# Altium schematic sheet Sheet3.SchDoc
size A4; SheetNumber: 3; SheetTotal: 3
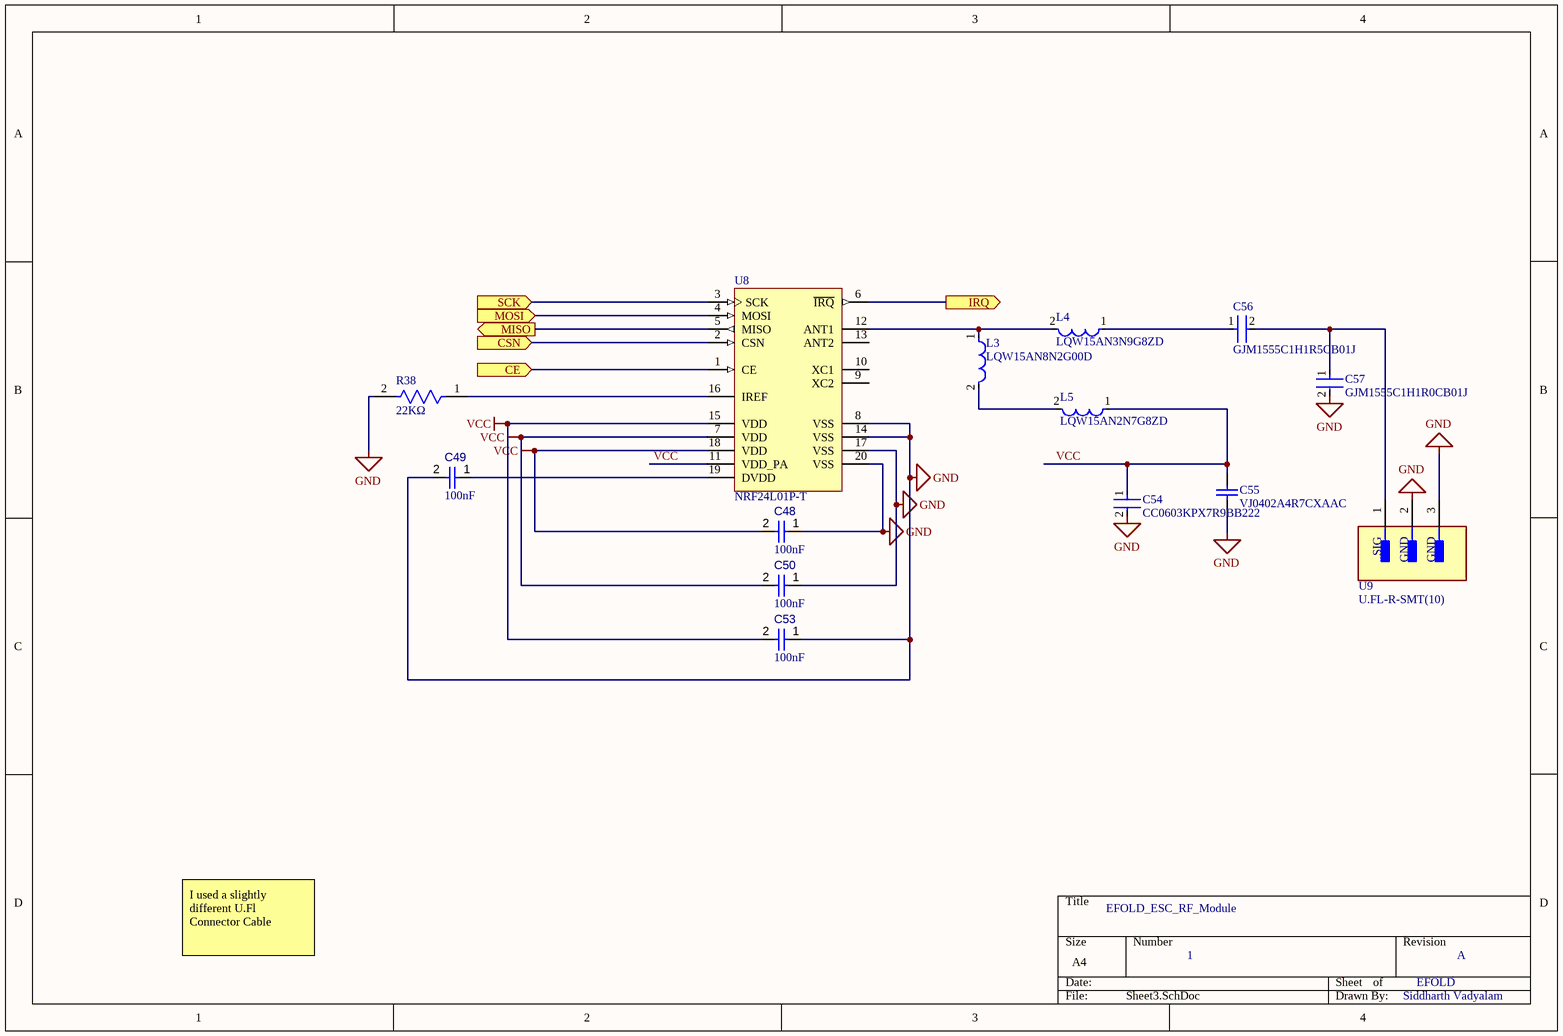
[diagram p0: Sheet3.SchDoc]

## Parts
C48  value 100nF  [CAPC1608X90X40NL10T20]  (hidden comment: Capacitor 100 nF +/-10% 50 V 0603)
C49  value 100nF  [CAPC1608X90X40NL10T20]  (hidden comment: Capacitor 100 nF +/-10% 50 V 0603)
C50  value 100nF  [CAPC1608X90X40NL10T20]  (hidden comment: Capacitor 100 nF +/-10% 50 V 0603)
C53  value 100nF  [CAPC1608X90X40NL10T20]  (hidden comment: Capacitor 100 nF +/-10% 50 V 0603)
C54  CC0603KPX7R9BB222  [FP-CC0603-DA-MFG]
C55  VJ0402A4R7CXAAC  [CAPC1005X60X26LL10T16]
C56  GJM1555C1H1R5CB01J  [FP-GJM155-0_05-IPC_C]
C57  GJM1555C1H1R0CB01J  [FP-GJM155-0_05-MFG]
L3  LQW15AN8N2G00D  [FP-LQW15AN_00-W0_6-0_1-MFG]
L4  LQW15AN3N9G8ZD  [FP-LQW15AN_80-MFG]
L5  LQW15AN2N7G8ZD  [FP-LQW15AN_80-MFG]
R38  22KΩ  [FP-CRGP0603-IPC_C]
U8  NRF24L01P-T  [NRSC-QFN-20_L]
U9  U.FL-R-SMT(10)  [FP-U_FL-R-SMT_10-MFG]

## Ports
CE (in), CSN (in), IRQ (out), MISO (out), MOSI (in), SCK (in)

## Nets
GND: C48.1 C49.2 C50.1 C53.1 C54.2 C55.1 C57.2 R38.2 U8.8(VSS) U8.14(VSS) U8.17(VSS) U8.20(VSS) U9.2(GND) U9.3(GND)
VCC: C48.2 C50.2 C53.2 C54.1 C55.2 L5.1 U8.7(VDD) U8.11(VDD_PA) U8.15(VDD) U8.18(VDD)
CE: U8.1(CE) ; port CE
CSN: U8.2(CSN) ; port CSN
IRQ: U8.6(~{IRQ}) ; port IRQ
MISO: U8.5(MISO) ; port MISO
MOSI: U8.4(MOSI) ; port MOSI
SCK: U8.3(SCK) ; port SCK
NetC49_1: C49.1 U8.19(DVDD)
NetC56_1: C56.1 L4.1
NetC56_2: C56.2 C57.1 U9.1(SIG)
NetL3_1: L3.1 L4.2 U8.12(ANT1)
NetL3_2: L3.2 L5.2
NetR38_1: R38.1 U8.16(IREF)

Not connected (* = marked no-connect by the designer): U8 9(XC2) 10(XC1) 13(ANT2)

## Notes on the sheet
- EFOLD_ESC_RF_Module
- I used a slightly different U.Fl Connector Cable
- 1
- EFOLD
- A
- Siddharth Vadyalam

## Library data of the parts
C48-C50 C53 = CMP-001-00017-6: Chip Capacitor, 100 nF, +/- 10%, 50 V, 0603 (1608 Metric); Voltage Rating: 50V; Capacitor Type: Ceramic; Tolerance: 10%; Mounting Technology: SM; Max Operating Temperature: 125°C; RoHS Compliant: True; Pins: 2; Case/Package: 0603; Min Operating Temperature: -55°C
C54 = CMP-03422-000860-1: CC0603 2.2 nF X7R 10.00% 50 V; Manufacturer: YAGEO; Tolerance: 0.1; Value: 2.2 nF; Voltage Rating: 50 V; Material: Ceramic; Temperature Coefficient: 15%; Package: CC0603-DA; Temperature Range High: +125°C; Temperature Range Low: -55°C; Temperature Characteristic: X7R; Device Class L3: Ceramic Capacitors; Lead Free: Yes; ComponentLink2URL: http://www.yageo.com/documents/recent/UPY-GPHC_X7R_6.3V-to-50V_18.pdf; Mouser Description: Multilayer Ceramic Capacitors MLCC - SMD/SMT 2.2nF 50V X7R 10%; RoHS: TRUE; ComponentLink2Description: Datasheet; Height: 0.9mm; Footprint Url: http://www.yageo.com/exep/pages/download/literatures/UPY-C_GEN_24.pdf; Category: Cap; Capacitance: 2.2 nF; Automotive: No; Device Class L1: Passive Components; Temperature: -55°C to +125°C; Device Class L2: Capacitors; Manufacturer Part Number: CC0603KPX7R9BB222; Octopart: https://octopart.com/cc0603kpx7r9bb222-yageo-25629160; Voltage: 50 V
C55 = CMP-2008-01052-1: Manufacturer: Vitramon; Part Number: VJ0402A4R7CXAAC
C56 = CMP-06035-023991-1: Multi-Layer Ceramic Capacitor 1.5pF C0G  ±0.25pF 0402 Paper T/R; Voltage Rating: 50V; Thickness: 500um; Width: 500um; Height: 0.5mm; Packaging: Tape and Reel; Capacitance: 1.5pF; Dielectric: C0G; Case Code (Metric): 1005; Depth: 0.5mm; Case/Package: 0402; Package Quantity: 50000; Radiation Hardening: No; Length: 1mm; Max Operating Temperature: 125°C; Termination: SMD/SMT; Voltage Rating (DC): 50V; Min Operating Temperature: -55°C; Mount: Surface Mount; Case Code (Imperial): 0402
C57 = CMP-06035-035255-1: Multi-Layer Ceramic Capacitor 1pF C0G  ±0.25pF 0402 Paper T/R; Voltage Rating: 50V; Length: 1mm; Radiation Hardening: No; Case/Package: 0402; Min Operating Temperature: -55°C; Depth: 0.5mm; Thickness: 500um; Package Quantity: 50000; Termination: SMD/SMT; Dielectric: C0G; Height: 0.5mm; Voltage Rating (DC): 50V; Packaging: Tape and Reel; Capacitance: 1pF; Case Code (Metric): 1005; Width: 500um; Max Operating Temperature: 125°C; Mount: Surface Mount; Case Code (Imperial): 0402
L3 = CMP-2000-06598-2: Wire Wound RF Inductor 8.2nH ±2% 540mA 0.14Ω 0402 (1005); DC Resistance (DCR): 140mR; Core Material: Air; Q Factor: 25; Test Frequency: 100MHz; Shielding: Unshielded; Self Resonant Frequency: 5.5GHz; DC Current: 540mA; Max DC Current: 540mA; Inductance Tolerance: 2%; Max Operating Temperature: 125°C; Lead Free: Lead Free; Termination: SMD/SMT; Current Rating: 540mA; Depth: 0.7mm; Packaging: Tape and Reel; Mount: Surface Mount; Package Quantity: 10000; Length: 1mm; Case/Package: 0402; Number of Pins: 2; Military Standard: Not; REACH SVHC: No SVHC; Tolerance: 2%; Width: 0.02inch; Case Code (Imperial): 0402; Radiation Hardening: No; Weight: 2.8E-05oz; Min Operating Temperature: -55°C; Height: 0.5mm; Inductance: 8.2nH; Case Code (Metric): 1005
L4 = CMP-06042-006448-1: Wire Wound RF Inductor for Automotive 3.9nH ±2% 1950mA 0.03Ω 0402 (1005); Shielding: Unshielded; Test Frequency: 100MHz; Current Rating: 1.95A; Core Material: Non-Magnetic; Self Resonant Frequency: 10GHz; DC Resistance (DCR): 30mR; Resistor Type: Wirewound; Ratings: AEC-Q200; Max Operating Temperature: 125°C; Min Operating Temperature: -55°C; Packaging: Cut Tape; Tolerance: 2%; Case/Package: Nonstandard; Inductance: 3.9nH
L5 = CMP-06042-003758-1: Wire Wound RF Inductor for Automotive 2.7nH ±2% 1500mA 0.047Ω 0402 (1005)
R38 = CMP-03211-006681-1: CRGP 0603 22K 1%; Manufacturer Part Number: CRGP0603F22K; Manufacturer: TE; Power Rating: 0.25W; Temperature Coefficient: ±100ppm/°C; Tolerance: 0.01; Voltage Rating: 50V; Resistance: 22KΩ; Lead Free: Yes; Device Class L3: Chip SMD Resistors; Ipc Land Pattern Name: RESC16080X45; Composition: Thick Film; Octopart: https://octopart.com/crgp0603f22k-te+connectivity-91018742; RoHS: TRUE; ComponentLink2Description: Datasheet; Digikey Description: CRGP 0603 22K 1%; Category: Res; Temperature: -55°C to +155°C; Temperature Range High: +155°C; Series: CRGP; ComponentLink2URL: https://www.te.com/commerce/DocumentDelivery/DDEController?Action=srchrtrv&DocNm=9-1773463-9&DocType=DS&DocLang=English; Device Class L2: Resistors; Height: 0.55mm; Value: 22KΩ; Ambient Temperature Range High: +70°C; Device Class L1: Passive Components; Automotive: No; Temperature Range Low: -55°C; Package: CRGP0603
U8 = CMP-2000-06859-1: Single Chip Transceiver, 2.4 GHz, 60 mW, 1.9 to 3.6 V, -40 to 85 degC, 20-Pin QFN, RoHS, Tray; Manufacturer: Nordic Semiconductor; Data Rate (Max): 2Mbps; Current - Transmitting: 7mA~11.3mA; Power - Output: 0dBm; Other Names: 1490-1019; Online Catalog: nRF24L01+; Current - Receiving: 12.6mA~13.5mA; For Use With: 1490-1002-ND-KITEVALUATIONNRF24L01P1568-1295-ND-SPARKFUNTRANSCEIVERBREAKOUT-1568-1296-ND-SPARKFUNTRANSCEIVERBREAKOUT-1471-1410-ND-DEVBOARDNRFSCLICKNRF24L01P-MODULE-PCB-ND-KITEVALNRF24L01+PCBANTENNANRF24L01P-MODULE-SMA-ND-KITEVALNRF24L01+SMACONNNRF24L01P-UPGRADE-ND-UPGRADE2PCB/1SMANRF24L01103990038-ND-DEVDUINOSENSORNODEV1.3103990053-ND-DEVDUINOSENSORNODEV2(ATMEGA103990074-ND-DEVDUINOSENSORNODE106990026-ND-ENERGYMONITORSHIELDV2113990088-ND-WIRELESSGATESHIELD113990095-ND-DEVDUINOSENSORNODEV3(ATMEGA106030001-ND-ENERGYMONITORSHIELD1597-1361-ND-DEVDUINOSENSORNODEV2.2(ATMEG105990030-ND-RGBWSTRIPWIRELESSSHIELDV1.0; Frequency: 2.4GHz; Design Resources: DevelopmentToolSelector; RF Family/Standard: GeneralISM>1GHZ; Serial Interfaces: SPI; Sensitivity: -94dBm; Voltage - Supply: 1.9V~3.6V; Modulation: GFSK; GPIO: -; Package Reference: QFN20; Memory Size: -; Category: RF/IFandRFID; Type: TxRxOnly; Standard Package: 490; Package / Case: 20-VFQFNExposedPad; Packaging: Tray; Series: -; Package Description: 20-Pin Quad Flat No-lead Package, Body 4 x 4 mm, Pitch 0.5 mm; Datasheet Version: Rev. 1.0, 09/2008; Protocol: -; Manufacturer URL: http://www.nordicsemi.com/eng/Products/; Operating Temperature: -40°C~85°C; Family: RFTransceiverICs; Datasheet URL: http://www.nordicsemi.com/eng/content/download/2726/34069/file/nRF24L01P_Product_Specification_1_0.pdf; Mounting Technology: SurfaceMount
U9 = CMP-0029-00003-2: CONN U.FL RCPT STR 50 OHM SMD; Plating: Silver; Connector Type: Coaxial; Frequency: 6GHz; Impedance: 50R; Body Material: Bronze; Dielectric Material: Polymer; Contact Plating: Gold; Termination: Solder; Orientation: Vertical; Contact Material: Brass; Min Operating Temperature: -40°C; Mount: Surface Mount; Lead Free: Lead Free; Max Operating Temperature: 90°C; Radiation Hardening: No; Packaging: Tape and Reel; Body Plating: Silver; Fastening Type: Snap; Max Frequency: 6GHz; Depth: 3.1mm; Package Quantity: 1; Case/Package: SMD/SMT; Housing Color: Beige; Length: 3mm